# Altium schematic sheet DAPlink_STM32F103-v1.0.0.SchDoc: DAPlink_STM32F103-v1.0.0
size 298 x 212 mm; Date: 1/1/2019 10:52:01 PM; SheetNumber: 1; GateName_1: G$1; SymbolName_1: MBED-HDK; LibraryName: mbed-HDK-misc-Template; DeviceSetName: MBED-HDK
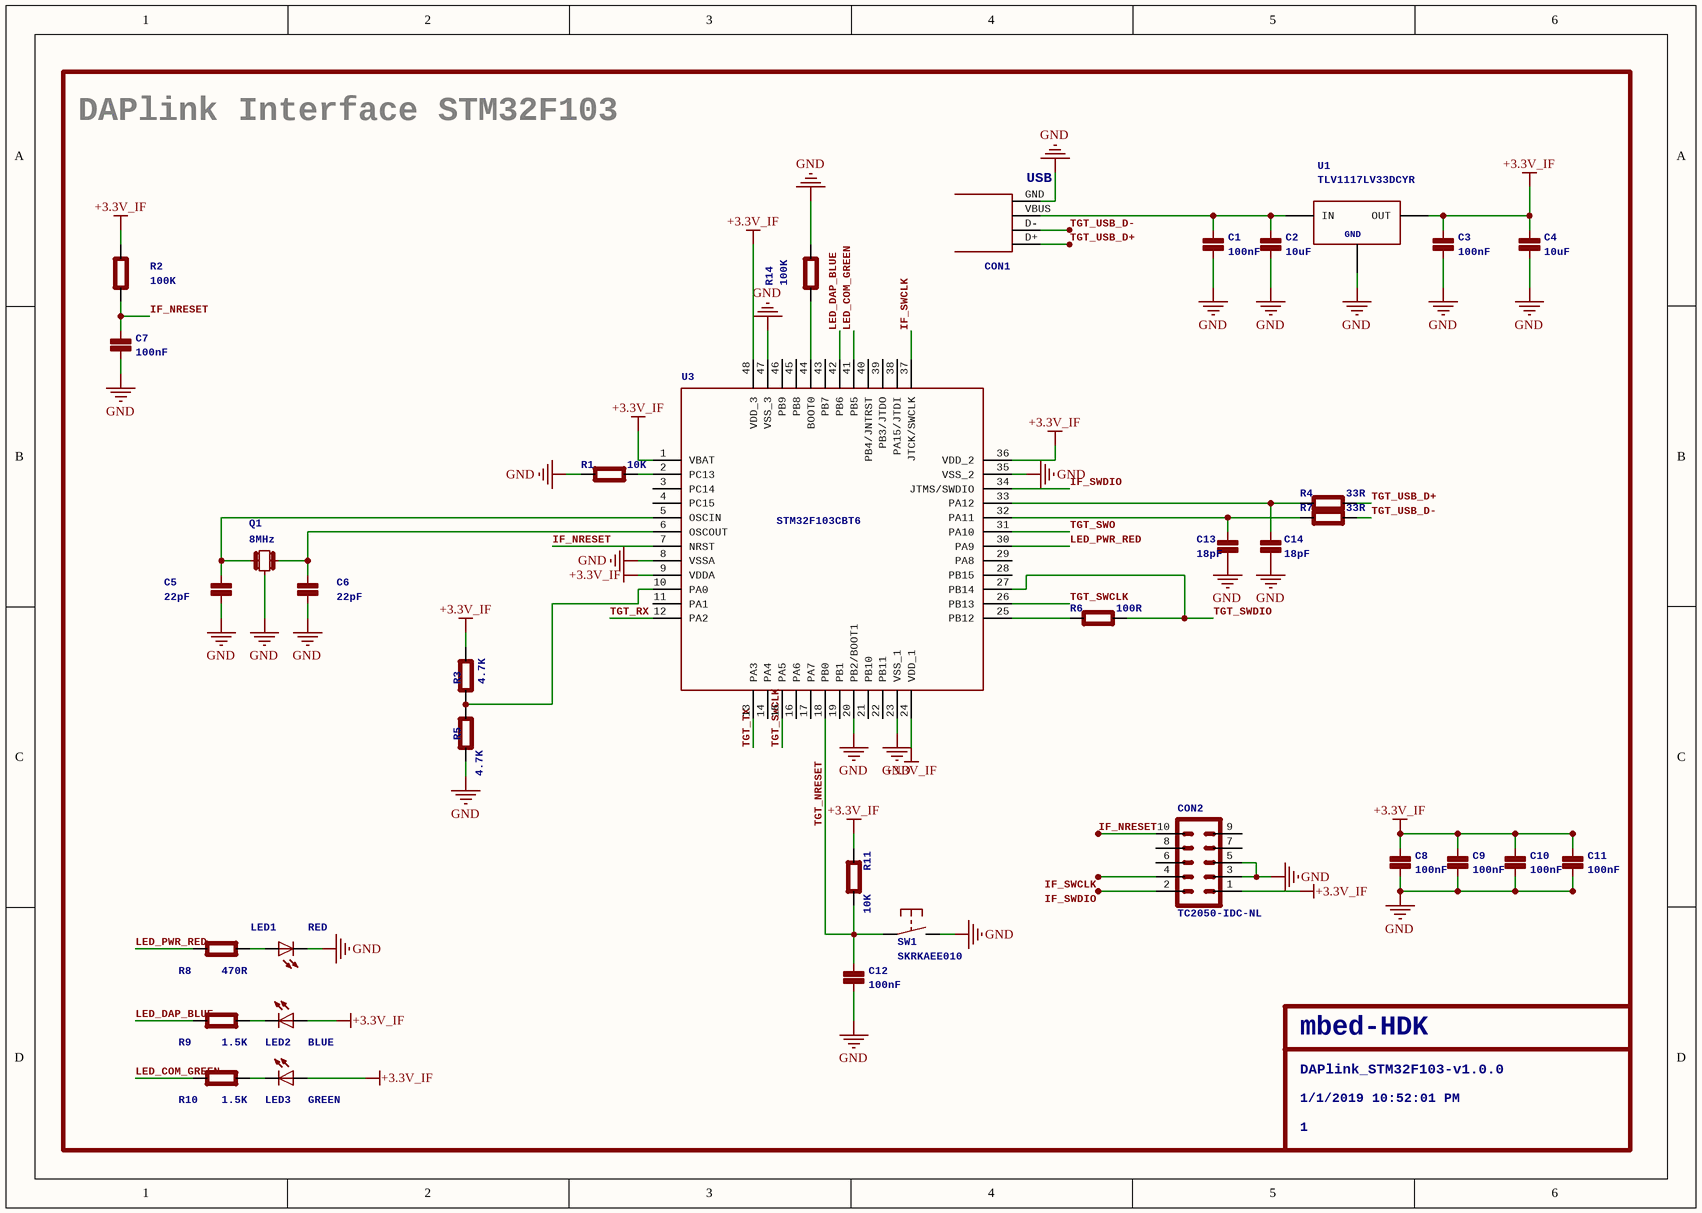
[diagram p0: DAPlink_STM32F103-v1.0.0.SchDoc]

## Parts
C1  100nF  [0402]
C2  10uF  [0603]
C3  100nF  [0402]
C4  10uF  [0603]
C5  22pF  [0402]
C6  22pF  [0402]
C7  100nF  [0402]
C8  100nF  [0402]
C9  100nF  [0402]
C10  100nF  [0402]
C11  100nF  [0402]
C12  100nF  [0402]
C13  18pF  [0402]
C14  18pF  [0402]
CON1  47346-0001  [USB-MICRO-B-H]  (value not drawn)
CON2  TC2050-IDC-NL  [TC2050-IDC-NL]
LED1  RED  [CHIPLED_0603]
LED2  BLUE  [CHIPLED_0603]
LED3  GREEN  [CHIPLED_0603]
Q1  8MHz  [CSTCE8M00G55-R0]
R1  10K  [0402]
R2  100K  [0402]
R3  4.7K  [0402]
R4  33R  [0402]
R5  4.7K  [0402]
R6  100R  [0402]
R7  33R  [0402]
R8  470R  [0402]
R9  1.5K  [0402]
R10  1.5K  [0402]
R11  10K  [0402]
R14  100K  [0402]
SW1  SKRKAEE010  [SKRKAEE010]
U1  TLV1117LV33DCYR  [SOT223]
U3  STM32F103CBT6  [LQFP48]

## Nets
+3.3V_IF: C3.1(P$1) C4.1(P$1) C8.1(P$1) C9.1(P$1) C10.1(P$1) C11.1(P$1) CON2.1 LED2.A LED3.A R2.1(P$1) R3.1(P$1) R11.1(P$1) U1.2_4(OUT) U3.1(VBAT) U3.9(VDDA) U3.24(VDD_1) U3.36(VDD_2) U3.48(VDD_3)
GND: C1.2(P$2) C2.2(P$2) C3.2(P$2) C4.2(P$2) C5.2(P$2) C6.2(P$2) C7.2(P$2) C8.2(P$2) C9.2(P$2) C10.2(P$2) C11.2(P$2) C12.2(P$2) C13.2(P$2) C14.2(P$2) CON1.GND CON2.3 CON2.5 LED1.C Q1.2 R1.1(P$1) R5.2(P$2) R14.1(P$1) SW1.P$2(S) U1.1(GND) U3.8(VSSA) U3.20(PB2/BOOT1) U3.23(VSS_1) U3.35(VSS_2) U3.47(VSS_3)
IF_NRESET: C7.1(P$1) CON2.10 R2.2(P$2) U3.7(NRST)
IF_SWCLK: CON2.4 U3.37(JTCK/SWCLK)
IF_SWDIO: CON2.2 U3.34(JTMS/SWDIO)
LED_COM_GREEN: R10.2(P$2) U3.41(PB5)
LED_DAP_BLUE: R9.2(P$2) U3.42(PB6)
LED_PWR_RED: R8.2(P$2) U3.30(PA9)
TGT_NRESET: C12.1(P$1) R11.2(P$2) SW1.P$1(P) U3.18(PB0)
TGT_RX: U3.12(PA2)
TGT_SWCLK: U3.15(PA5) U3.26(PB13)
TGT_SWDIO: R6.2(P$2) U3.27(PB14)
TGT_SWO: U3.31(PA10)
TGT_TX: U3.13(PA3)
TGT_USB_D+: CON1.D+ R4.2(P$2)
TGT_USB_D-: CON1.D- R7.2(P$2)
NetC1_1: C1.1(P$1) C2.1(P$1) CON1.VBUS U1.3(IN)
NetC5_1: C5.1(P$1) Q1.1 U3.5(OSCIN)
NetC6_1: C6.1(P$1) Q1.3 U3.6(OSCOUT)
NetC13_1: C13.1(P$1) R7.1(P$1) U3.32(PA11)
NetC14_1: C14.1(P$1) R4.1(P$1) U3.33(PA12)
NetLED1_A: LED1.A R8.1(P$1)
NetLED2_C: LED2.C R9.1(P$1)
NetLED3_C: LED3.C R10.1(P$1)
NetR1_2: R1.2(P$2) U3.2(PC13)
NetR3_2: R3.2(P$2) R5.1(P$1) U3.10(PA0)
NetR6_1: R6.1(P$1) U3.25(PB12)
NetR14_2: R14.2(P$2) U3.44(BOOT0)

Not connected (* = marked no-connect by the designer): CON2 6 7 8 9; U3 3(PC14) 4(PC15) 11(PA1) 14(PA4) 16(PA6) 17(PA7) 19(PB1) 21(PB10) 22(PB11) 28(PB15) 29(PA8) 38(PA15/JTDI) 39(PB3/JTDO) 40(PB4/JNTRST) 43(PB7) 45(PB8) 46(PB9)

## Notes on the sheet
- DAPlink Interface STM32F103
- DAPlink_STM32F103-v1.0.0
- mbed-HDK
- 1/1/2019 10:52:01 PM
- 1

## Library data of the parts
C1 C3 C5-C14 = CAPACITOR0402: Capacitor; GateName_1: G$1; SymbolName_1: CAPACITOR; DeviceName: 0402; DeviceSetName: CAPACITOR
  C1 C3 C7-C12: LibraryName: mbed-HDK-RLCQ
  C5 C6 C13 C14: LibraryName: mbed-HDK-RLC
C2 C4 = CAPACITOR0603: Capacitor; GateName_1: G$1; SymbolName_1: CAPACITOR; DeviceName: 0603; LibraryName: mbed-HDK-RLC; DeviceSetName: CAPACITOR
CON1 = 47346-0001: USB Receptacle Horizontal Micro Type B; GateName_1: A; MF: MOLEX; SymbolName_1: USB; LibraryName: mbed-HDK-Connector; DeviceSetName: 47346-0001; MFN: 47346-0001; OC-MOUSER: 538-47346-0001; OC-NEWARK: 1568026; USB: USB
CON2 = TC2050-IDC-NL: Tag-Connect In Circuit Programming & Debug Cable 10 Pin; GateName_1: A; DeviceName: -NL; SymbolName_1: TC2050-IDC; LibraryName: mbed-HDK-Connector; DeviceSetName: TC2050-IDC
LED1-LED3 = LED0603: LED SMD; GateName_1: G$1; DeviceName: 0603; SymbolName_1: LED; LibraryName: mbed-HDK-Optical; DeviceSetName: LED
Q1 = CSTCE8M00G55-R0: Resonator Cermanic, Murata 8MHz 33pF; GateName_1: G$1; SymbolName_1: RESONATOR; LibraryName: mbed-HDK-Oscillator; DeviceSetName: CSTCE8M00G55-R0; MF: Murata; MFN: CSTCE8M00G55-R0; OC-DIGIKEY: 490-1195-1-ND; OC-MOUSER: 81-CSTCE8M00G55-R0; OC-NEWARK: 2443270
R1-R11 R14 = RESISTOR0402: Resistor; GateName_1: G$1; SymbolName_1: RESISTOR; DeviceName: 0402; DeviceSetName: RESISTOR
  R1 R4 R6 R7: LibraryName: mbed-HDK-RLC
  R2 R3 R5 R8-R11 R14: LibraryName: mbed-HDK-RLCQ
SW1 = SKRKAEE010: MOMENTARY SWITCH PUSH VERTICAL (SPST); GateName_1: G$1; MF: ALPS; SymbolName_1: SPST; LibraryName: mbed-HDK-Switch; DeviceSetName: SKRKAEE010; MFN: SKRKAEE010; OC-DIGIKEY: *; OC-MOUSER: 688-SKRKAE; OC-NEWARK: *
U1 = TLV1117LV33DCYR: LDO Fixed Regulator 3.3v, 1A; GateName_1: G$1; MF: Texas Instruments; SymbolName_1: TLV1117LV33DCYR; LibraryName: mbed-HDK-Power; DeviceSetName: TLV1117LV33DCYR; MFN: TLV1117LV33DCYR; OC-DIGIKEY: 296-28778-1-ND; OC-MOUSER: 595-TLV1117LV33DCYR; OC-NEWARK: 2323647; GND: GND
U3 = STM32F103CBT6: ARM庐 Cortex庐-M3 STM32 F1 Microcontroller IC 32-Bit 72MHz 128KB (128K x 8) FLASH; GateName_1: G$1; MF: STMicroelectronics; SymbolName_1: STM32F103CBT6; LibraryName: mbed-HDK-MF-ST; DeviceSetName: STM32F103CBT6; MFN: STM32F103CBT6; OC-DIGIKEY: 497-6288-ND; OC-MOUSER: 511-STM32F103CBT6; OC-NEWARK: 11N8296